# Altium schematic sheet Two_Switch_Flyback.SchDoc
size 420 x 297 mm; SheetNumber: 1; SheetTotal: 1
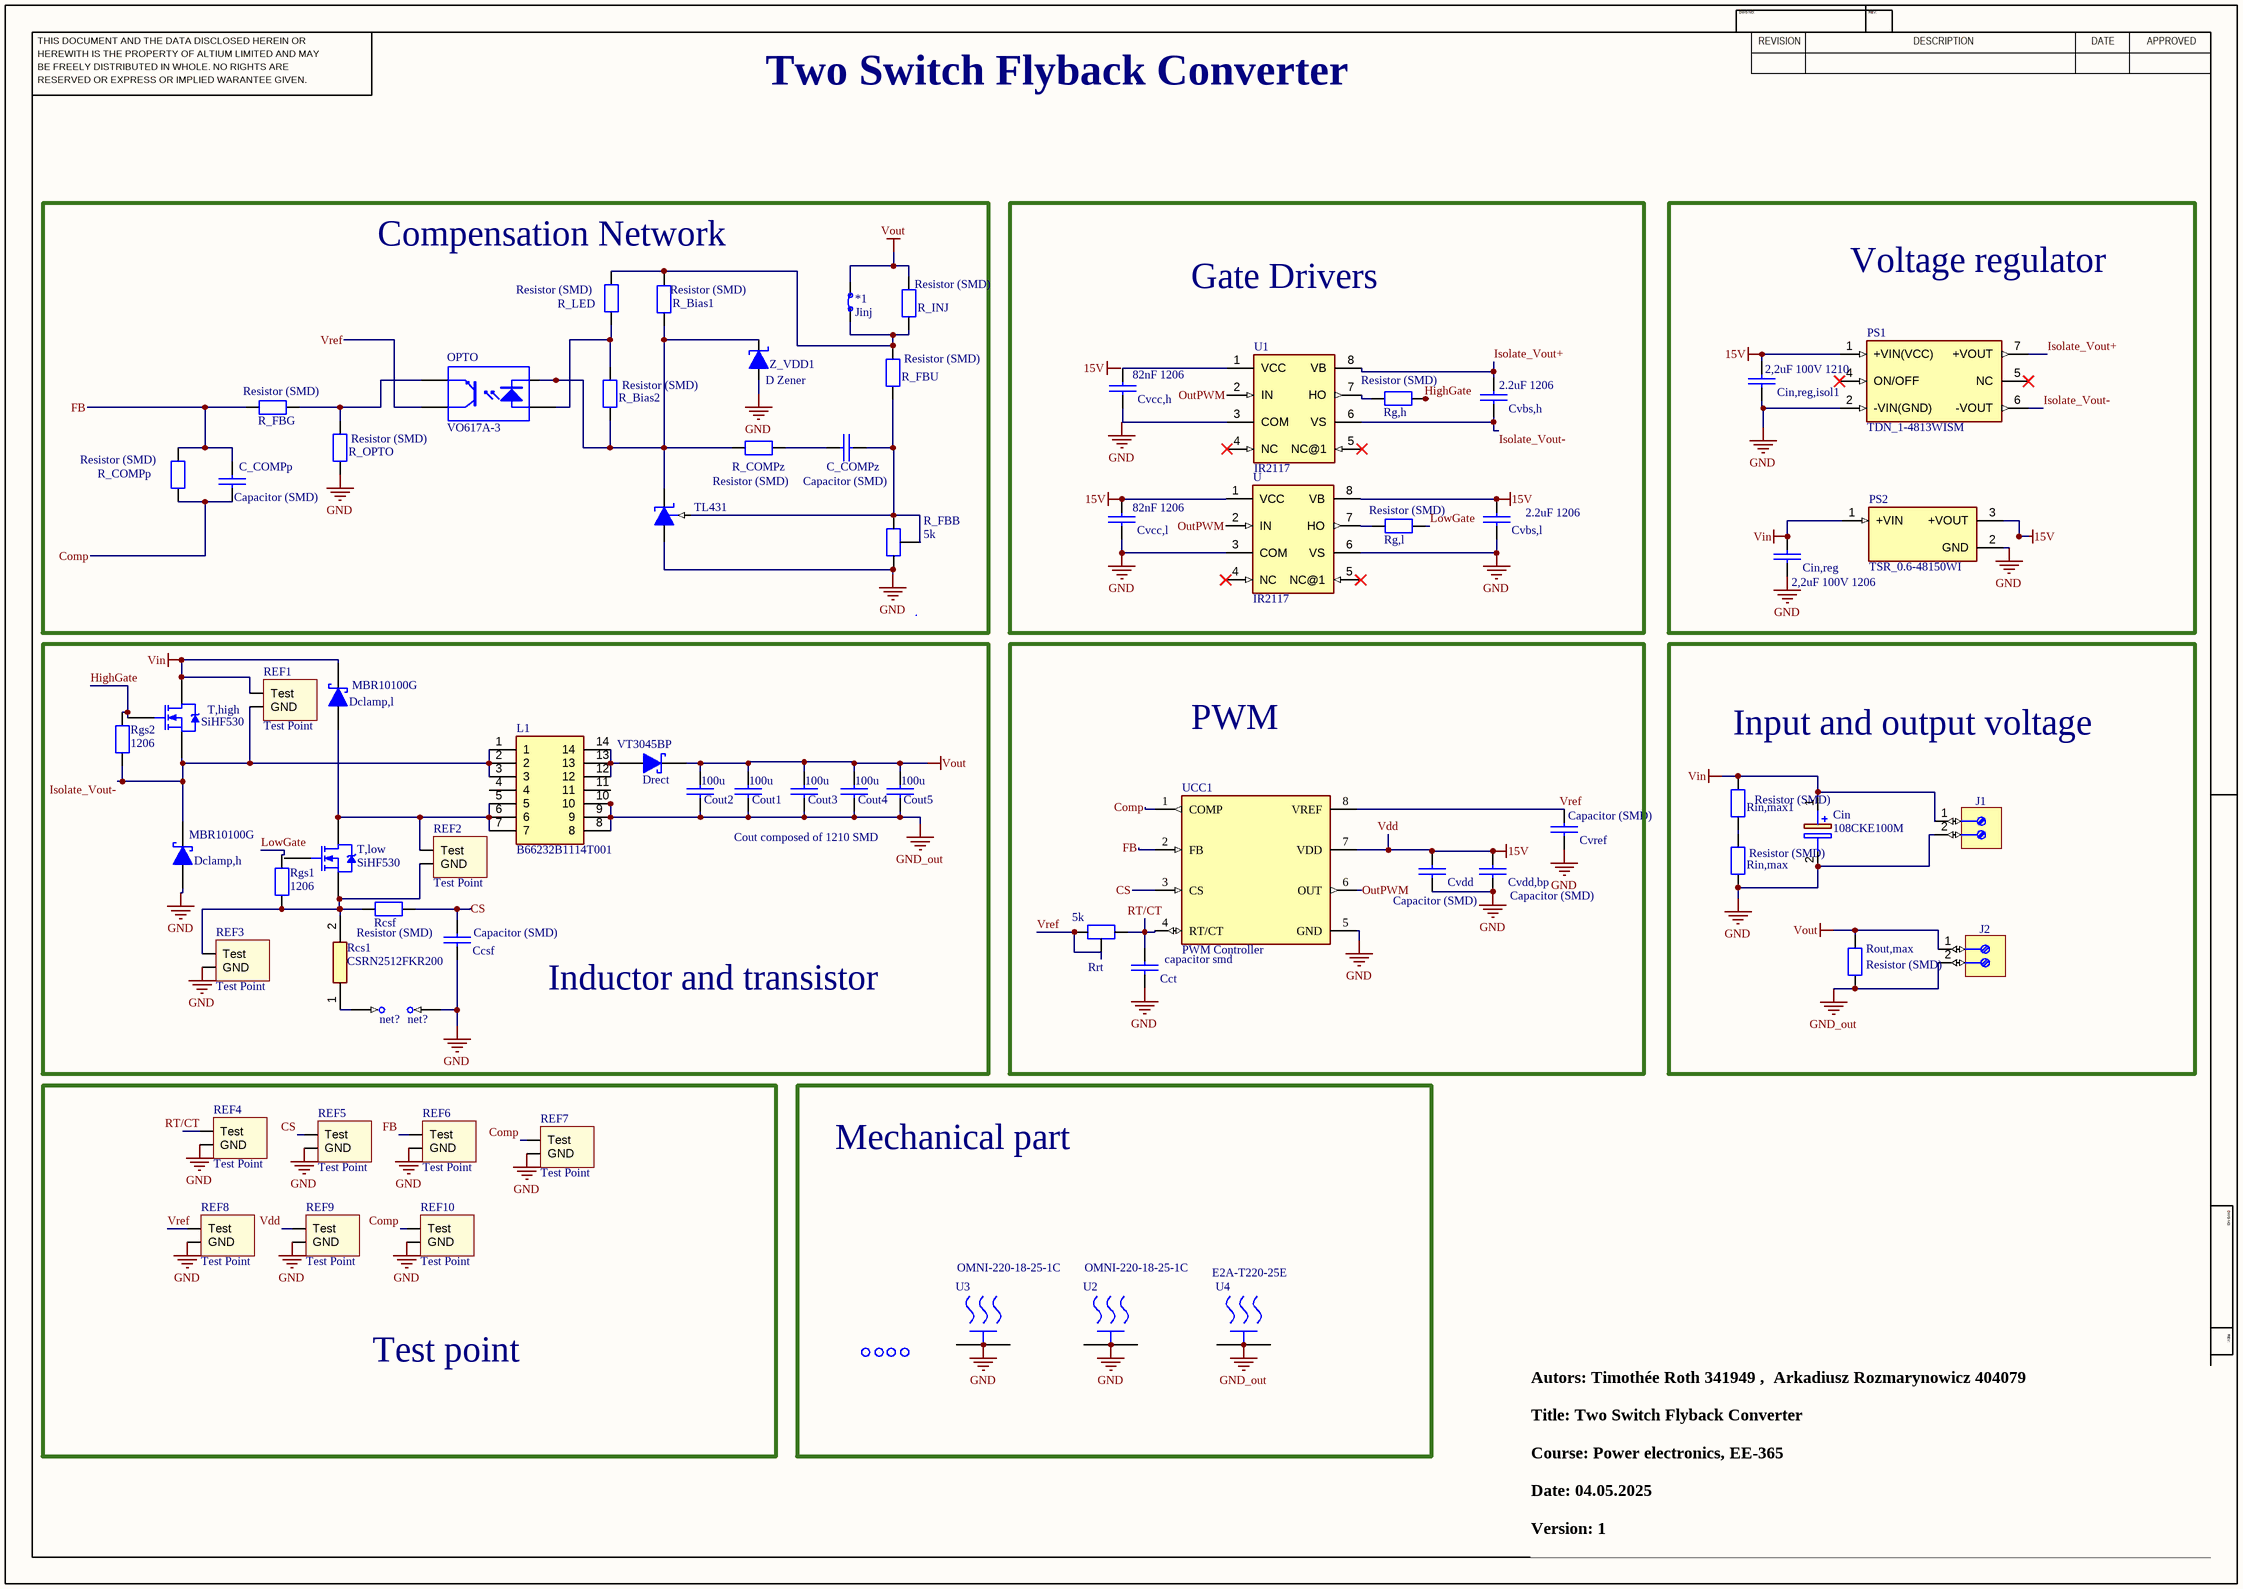
[diagram p0: Two_Switch_Flyback.SchDoc]

## Parts
*1  Jinj  [jumper]
B1  (no value)  [Hole]
B2  (no value)  [Hole]
B3  (no value)  [Hole]
B4  (no value)  [Hole]
C_COMPp  Capacitor (SMD)  [SM/1210]
C_COMPz  Capacitor (SMD)  [SM/1210]
Ccsf  Capacitor (SMD)  [SM/1210]
Cct  capacitor smd  [SM/1210]
Cin  108CKE100M  [CAPPRD750W80D1825H4150]
Cin,reg  2,2uF 100V 1206  [SM/1210]
Cin,reg,isol1  2,2uF 100V 1210  [SM/1210]
Cout1  100u  [SM/1210]
Cout2  100u  [SM/1210]
Cout3  100u  [SM/1210]
Cout4  100u  [SM/1210]
Cout5  100u  [SM/1210]
Cvbs,h  2.2uF 1206  [SM/1210]
Cvbs,l  2.2uF 1206  [SM/1210]
Cvcc,h  82nF 1206  [SM/1210]
Cvcc,l  82nF 1206  [SM/1210]
Cvdd  Capacitor (SMD)  [SM/1210]
Cvdd,bp  Capacitor (SMD)  [SM/1210]
Cvref  Capacitor (SMD)  [SM/1210]
Dclamp,h  MBR10100G  [TO-220AC]
Dclamp,l  MBR10100G  [TO-220AC]
Drect  VT3045BP  [TO-220AC]
J1  (no value)  [PHOENIX  1755736]
J2  (no value)  [PHOENIX  1755736]
L1  B66232B1114T001  [B66232B1114T001]
OPTO  VO617A-3  [DIP4 Socket]
PS1  TDN_1-4813WISM  [CONV_TDN_1-4813WISM]
PS2  TSR_0.6-48150WI  [CONV_TSR_0.6-48150WI]
R_Bias1  Resistor (SMD)  [SM/1206]
R_Bias2  Resistor (SMD)  [SM/1206]
R_COMPp  Resistor (SMD)  [SM/1206]
R_COMPz  Resistor (SMD)  [SM/1206]
R_FBB  5k  [TRIMMER CT-6EP]
R_FBG  Resistor (SMD)  [SM/1206]
R_FBU  Resistor (SMD)  [SM/1206]
R_INJ  Resistor (SMD)  [SM/1206]
R_LED  Resistor (SMD)  [SM/1206]
R_OPTO  Resistor (SMD)  [SM/1206]
Rcs1  CSRN2512FKR200  [RESC6432X70N]
Rcsf  Resistor (SMD)  [SM/1206]
REF1  Test Point  [TESTPOINT HDR1X2]
REF2  Test Point  [TESTPOINT HDR1X2]
REF3  Test Point  [TESTPOINT HDR1X2]
REF4  Test Point  [TESTPOINT HDR1X2]
REF5  Test Point  [TESTPOINT HDR1X2]
REF6  Test Point  [TESTPOINT HDR1X2]
REF7  Test Point  [TESTPOINT HDR1X2]
REF8  Test Point  [TESTPOINT HDR1X2]
REF9  Test Point  [TESTPOINT HDR1X2]
REF10  Test Point  [TESTPOINT HDR1X2]
Rg,h  Resistor (SMD)  [SM/1206]
Rg,l  Resistor (SMD)  [SM/1206]
Rgs1  1206  [SM/1206]
Rgs2  1206  [SM/1206]
Rin,max  Resistor (SMD)  [SM/1206]
Rin,max1  Resistor (SMD)  [SM/1206]
Rout,max  Resistor (SMD)  [SM/1206]
Rrt  5k  [TRIMMER CT-6EP]
T,high  SiHF530  [TO-220AB]
T,low  SiHF530  [TO-220AB]
TL431  TL431  [TO-92 Straight Lead]  (value not drawn)
TP1  net?  [MY_TestPin]  (no BOM)
TP2  net?  [MY_TestPin]  (no BOM)
U  IR2117  [DIL08]
U1  IR2117  [DIL08]
U2  OMNI-220-18-25-1C  [OMNI22018251C]
U3  OMNI-220-18-25-1C  [OMNI22018251C]
U4  E2A-T220-25E  [E2AT22025E]
UCC1  PWM Controller  [UCCx8C4x PDIP Package]
Z_VDD1  D Zener  [DO-15 Package (D0-204AC)]

## Blocks framed on the sheet
Compensation Network: *1 C_COMPp C_COMPz OPTO R_Bias1 R_Bias2 R_COMPp R_COMPz R_FBB R_FBG R_FBU R_INJ R_LED R_OPTO TL431 Z_VDD1
Gate Drivers: Cvbs,h Cvbs,l Cvcc,h Cvcc,l Rg,h Rg,l U U1
Voltage regulator: Cin,reg Cin,reg,isol1 PS1 PS2
Inductor and transistor: Ccsf Cout1-Cout5 Dclamp,h Dclamp,l Drect L1 Rcs1 Rcsf REF1-REF3 Rgs1 Rgs2 T,high T,low TP1 TP2
PWM: Cct Cvdd Cvdd,bp Cvref Rrt UCC1
Input and output voltage: Cin J1 J2 Rin,max Rin,max1 Rout,max
Test point: REF4-REF10
Mechanical part: B1-B4 U2-U4

## Nets
GND: Ccsf.2 Cct.2 Cin.2(-) Cin,reg.2 Cin,reg,isol1.1 Cvbs,l.2 Cvcc,l.1 Cvdd.1 Cvdd,bp.1 Cvref.1 Dclamp,h.3(A) J1.2 PS1.2(-VIN(GND)) PS2.2(GND) R_FBB.3 R_OPTO.1 REF3.2(GND) REF4.2(GND) REF5.2(GND) REF6.2(GND) REF7.2(GND) REF8.2(GND) REF9.2(GND) REF10.2(GND) Rin,max.2 TL431.2(ANODE) TP2.1 U.3(COM) U.6(VS) U2.1(MNT_1) U2.2 U3.1(MNT_1) U3.2 UCC1.5(GND) Z_VDD1.2(K)
GND_out: Cout1.2 Cout2.2 Cout3.2 Cout4.2 Cout5.2 J2.2 L1.8 L1.9 L1.10 Rout,max.2 U4.1(MNT_1) U4.2
Vdd: Cin,reg,isol1.2 Cvbs,l.1 Cvcc,l.2 Cvdd.2 Cvdd,bp.2 PS1.1(+VIN(VCC)) PS2.3(+VOUT) REF9.1(Test) U.1(VCC) U.8(VB) UCC1.7(VDD)  [also labelled 15V]
Vin: Cin.1(+) Cin,reg.1 Dclamp,l.1(K) J1.1 PS2.1(+VIN) REF1.1(Test) Rin,max1.1 T,high.2(D)
Vout: *1.1 Cout1.1 Cout2.1 Cout3.1 Cout4.1 Cout5.1 Drect.1(K) J2.1 R_INJ.2 Rout,max.1
Comp: C_COMPp.2 R_COMPp.1 REF7.1(Test) REF10.1(Test) UCC1.1(COMP)
CS: Ccsf.1 Rcsf.2 REF5.1(Test) UCC1.3(CS)
FB: C_COMPp.1 R_COMPp.2 R_FBG.1 REF6.1(Test) UCC1.2(FB)
HighGate: Rg,h.1 Rgs2.2 T,high.1(G)
Isolate_Vout+: Cvbs,h.1 PS1.7(+VOUT) U1.8(VB)
Isolate_Vout-: Cvbs,h.2 Dclamp,h.1(K) L1.1 L1.2 L1.3 PS1.6(-VOUT) REF1.2(GND) Rgs2.1 T,high.3(S) U1.6(VS)
LowGate: Rg,l.1 Rgs1.1
OutPWM: U.2(IN) U1.2(IN) UCC1.6(OUT)
RT/CT: Cct.1 REF4.1(Test) Rrt.1 UCC1.4(RT/CT)
Vref: Cvref.2 OPTO.4(COLLECTOR) REF8.1(Test) Rrt.2 Rrt.3 UCC1.8(VREF)
Net*1_2: *1.2 R_Bias1.2 R_FBU.2 R_INJ.1 R_LED.2
NetC_COMPz_1: C_COMPz.1 R_COMPz.2
NetC_COMPz_2: C_COMPz.2 R_FBB.1 R_FBB.2 R_FBU.1 TL431.1(REF)
NetCvcc,h_1: Cvcc,h.1 U1.3(COM)
NetCvcc,h_2: Cvcc,h.2 U1.1(VCC)
NetDclamp,l_3: Dclamp,l.3(A) L1.5 L1.6 L1.7 REF2.1(Test) T,low.2(D)
NetDrect_3: Drect.3(A) L1.12 L1.13 L1.14
NetOPTO_1: OPTO.1(ANODE) R_Bias2.2 R_LED.1
NetOPTO_2: OPTO.2(CATHODE) R_Bias1.1 R_Bias2.1 R_COMPz.1 TL431.3(CATHODE) Z_VDD1.1(A)
NetOPTO_3: OPTO.3(EMITTER) R_FBG.2 R_OPTO.2
NetRcs1_1: Rcs1.1 TP1.1
NetRcs1_2: Rcs1.2 Rcsf.1 REF2.2(GND) REF3.1(Test) Rgs1.2 T,low.3(S)
NetRg,h_2: Rg,h.2 U1.7(HO)
NetRg,l_2: Rg,l.2 U.7(HO)
NetRin,max_1: Rin,max.1 Rin,max1.2

Not connected (* = marked no-connect by the designer): B1 1; B2 1; B3 1; B4 1; L1 4 11; PS1 4(ON/OFF)* 5(NC)*; T,low 1(G); U 4(NC)* 5(NC@1)*; U1 4(NC)* 5(NC@1)*

## Notes on the sheet
- Two Switch Flyback Converter
- Cout composed of 1210 SMD
- Autors: Timothée Roth 341949 ,  Arkadiusz Rozmarynowicz 404079
  Title: Two Switch Flyback Converter
  Course: Power electronics, EE-365
  Date: 04.05.2025
  Version: 1
- Labels drawn without touching a wire or pin: 15V, GND
- THIS DOCUMENT AND THE DATA DISCLOSED HEREIN OR
- HEREWITH IS THE PROPERTY OF ALTIUM LIMITED AND MAY
- DWG NO:
- REVISION
- REV:
- DESCRIPTION
- DATE
- APPROVED
- BE FREELY DISTRIBUTED IN WHOLE. NO RIGHTS ARE
- RESERVED OR EXPRESS OR IMPLIED WARANTEE GIVEN.
- ENG:
- APPROVALS
- PROJECT
- DSN:
- CHK:
- REFERENCE DOCUMENTS
- PROJECT REVISION:
- TITLE
- DOCUMENT REVISION:
- DESIGN ITEM:
- BOM:
- FAB DWG:
- PCB DWG:
- ASSY DWG:
- SCALE:
- A3
- SIZE
- CAGE CODE
- FILE NAME
- DWG NO.
- SHEET
- OF
- REV

## Library data of the parts
*1 = Jumper
B1-B4 = Hole: Single Terminal Socket
C_COMPp C_COMPz Ccsf Cct Cin,reg Cin,reg,isol1 Cout1-Cout5 Cvbs,h Cvbs,l Cvcc,h Cvcc,l Cvdd Cvdd,bp Cvref = Capacitor (SMD): Capacitor (non polarized)
Cin = CMP-001-00083-1: Capacitor Polarised; Manufacturer_Name: Cornell Dubilier; Design Item ID: 108CKE100M; Mouser Part Number: 598-108CKE100M; Source: SamacSys.SchLib; Mouser Price/Stock: https://www.mouser.co.uk/ProductDetail/CDE-Illinois-Capacitor/108CKE100M?qs=3tP%252BN51vMXfMIheRqHQC6Q%3D%3D; Manufacturer_Part_Number: 108CKE100M; Height: 41.5mm; Datasheet Link: https://www.mouser.com/datasheet/2/88/ckh_cke-611140.pdf
Dclamp,h Dclamp,l Drect = Schottky Diode
J1 J2 = Phoenix-1755736: Connector 2 pos
L1 = B66232B1114T001: Inductor; Manufacturer_Name: TDK; Datasheet Link: https://product.tdk.com/system/files/dam/doc/product/ferrite/ferrite/ferrite-acc/data_sheet/80/db/fer/e_30_15_7.pdf; Height: 20mm; Manufacturer_Part_Number: B66232B1114T001; Mouser Part Number: 871-B66232B1114T001; Mouser Price/Stock: https://www.mouser.co.uk/ProductDetail/EPCOS-TDK/B66232B1114T001?qs=%2FsLciWRBLmBx8w3EjzXFqQ%3D%3D
OPTO = Optocoupler: Optocoupler, Phototransistor Output, High Reliability, 5300 VRMS, -55 to 110 degC, 4-Pin DIP, RoHS, Tape and Reel
PS1 = TDN_1-4813WISM: Convertidor CC-CC; Entrada (V) 18-75 VCC, Salida (VCC) 15 (A) 0,07 | TRACO Power TDN 1-4813WISM; SnapEDA_Link: https://www.snapeda.com/parts/TDN%201-4813WISM/Traco+Power/view-part/?ref=snap; Package: SMD-8 Traco Power; Value: *; MF: Traco Power; MP: TDN 1-4813WISM; Check_prices: https://www.snapeda.com/parts/TDN%201-4813WISM/Traco+Power/view-part/?ref=eda
R_Bias1 R_Bias2 R_COMPp R_COMPz R_FBG R_FBU R_INJ R_LED R_OPTO Rcsf Rg,h Rg,l Rgs1 Rgs2 Rin,max Rin,max1 Rout,max = Resistor (SMD): Resistor (Surface Mounted)
R_FBB Rrt = Variable Resistor
Rcs1 = CSRN2512FKR200: Resistor; Manufacturer_Name: Stackpole Electronics; Datasheet Link: https://cs.seielect.com/catalog/SEI-CSR_CSRN.pdf; Height: 0.7mm; Manufacturer_Part_Number: CSRN2512FKR200; Arrow Part Number: CSRN2512FKR200; Arrow Price/Stock: https://www.arrow.com/en/products/csrn2512fkr200/stackpole-electronics?region=nac
T,high T,low = NMOS-2: N-Channel Power MOSFET
TL431 = TL431: Texas Instruments TL431 Adjustable Precision Shunt Regulator, 34 ppm / degC, 100 mA, -40 to 85 degC, 3-pin TO-92 (LP), Pb-Free (RoHS); PartNumber: TL431ILP; Iout/Iz(Max)(mA): 100; Rating: Military; Temp Coeff(Typ)(ppm/ degree C): 34; Initial Accuracy @ 25/deg C(%): 2; SubFamily: Shunt Voltage Reference; VO Adj(Max)(V): 36; VO Adj(Min)(V): 2.495; Temp Coeff(Max)(ppm/ degree C): 92; Min Iz for Regulation(uA): 600; PackageReference: LP0003A; ComponentLink1URL: http://www.ti.com/; ComponentLink1Description: Manufacturer URL; Eco-Plan: Pb-Free (RoHS); ComponentLink3URL: http://www.ti.com/litv/pdf/msot002a; DatasheetVersion: SLVS543M; ComponentLink2Description: Datasheet; Mounting Technology: Through Hole; Manufacturer: Texas Instruments; ComponentLink3Description: Package Specification; PackageDescription: Plastic Cylindrical Package, Formed Lead Option (TO-92); ComponentLink2URL: http://www.ti.com/general/docs/lit/getliterature.tsp?genericPartNumber=TL431&fileType=pdf; Code_JEDEC: TO-226; PackageVersion: 4040001-2/C; Manufacturer Part Number: TL431ILP
TP1 TP2 = Test Point_1: Test point; ASiD Part Number: Test Point-AS
U U1 = IR2117: High-Side Gate Driver IC Non-Inverting 8-SOIC; MF: Infineon; Package: DIP-8 International Rectifier; MP: IR2117; Value: *; Price: None; Availability: Unavailable; SnapEDA_Link: https://www.snapeda.com/parts/IR2117/Infineon%20Technologies/view-part/1671776/?ref=snap
U2 U3 = OMNI-220-18-25-1C: Undefined or Miscellaneous; Manufacturer_Name: Wakefield Thermal; Datasheet Link: https://wakefieldthermal.com/content/data_sheets/OMNIKLIP/omniKlip%20Wakefield%20Vette.pdf; Height: 38mm; Manufacturer_Part_Number: OMNI-220-18-25-1C; Mouser Part Number: 567-OMNI220-18-25-1C; Mouser Price/Stock: https://www.mouser.co.uk/ProductDetail/Wakefield-Thermal/OMNI-220-18-25-1C?qs=u4fy%2FsgLU9OPVK9dgaPYLQ%3D%3D
U4 = E2A-T220-25E: Undefined or Miscellaneous; Manufacturer_Name: Ohmite; Datasheet Link: https://www.ohmite.com/assets/docs/sink_ex.pdf?r=false; Height: 25.4mm; Manufacturer_Part_Number: E2A-T220-25E; Mouser Part Number: 588-E2A-T220-25E; Mouser Price/Stock: https://www.mouser.co.uk/ProductDetail/Ohmite/E2A-T220-25E?qs=Ey4jopcCj2q8O3LMZTmuTA%3D%3D
UCC1 = UCCx8C4x: Texas Instruments UCCx8C4x PWM Controller
Z_VDD1 = Zener: Zener Diode
PS2 = TSR_0.6-48150WI: MP: TSR_0.6-48150WI; Package: None; Availability: Unavailable; Price: None; Value: *